# Altium schematic sheet PMIC.SchDoc
size A4; SheetNumber: 5; SheetTotal: 7
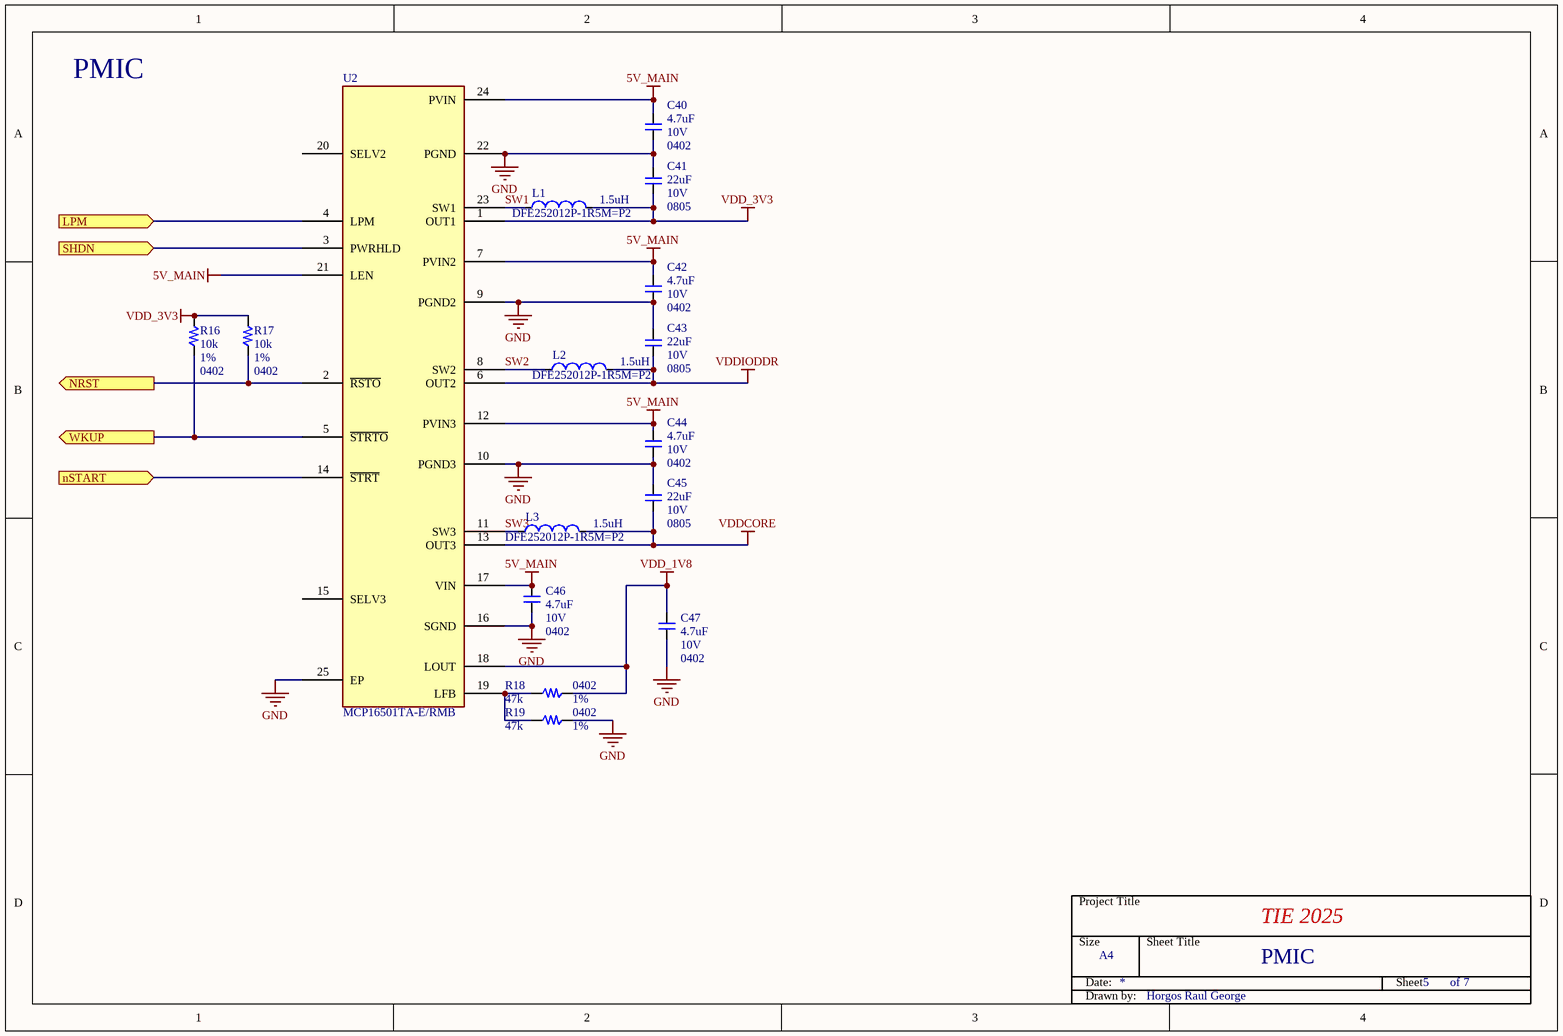
[diagram p0: PMIC.SchDoc]

## Parts
C40  4.7uF  Package: 0402  Rated Voltage: 10V  [CAP0402]
C41  22uF  Rated Voltage: 10V  Package: 0805  [CAP0805]
C42  4.7uF  Package: 0402  Rated Voltage: 10V  [CAP0402]
C43  22uF  Rated Voltage: 10V  Package: 0805  [CAP0805]
C44  4.7uF  Package: 0402  Rated Voltage: 10V  [CAP0402]
C45  22uF  Rated Voltage: 10V  Package: 0805  [CAP0805]
C46  4.7uF  Package: 0402  Rated Voltage: 10V  [CAP0402]
C47  4.7uF  Package: 0402  Rated Voltage: 10V  [CAP0402]
L1  1.5uH  [INDUCTOR1008]
L2  1.5uH  [INDUCTOR1008]
L3  1.5uH  [INDUCTOR1008]
R16  10k  Tolerance: 1%  Package: 0402  [RES0402]
R17  10k  Tolerance: 1%  Package: 0402  [RES0402]
R18  47k  Tolerance: 1%  Package: 0402  [RES0402]
R19  47k  Tolerance: 1%  Package: 0402  [RES0402]
Title_5  Title Block  (value not drawn)  (graphical)
U2  MCP16501TA-E/RMB  [QFN-24]

## Ports
LPM (in, see MPU-System[1B]), NRST (out, see MPU-System[1A], SDCard-MIPI-User[2D]), nSTART (in, see SDCard-MIPI-User[1D]), SHDN (in, see MPU-System[1B]), WKUP (out, see MPU-System[1B])

## Nets
5V_MAIN: C40.2 C42.2 C44.2 C46.2 U2.7(PVIN2) U2.12(PVIN3) U2.17(VIN) U2.21(LEN) U2.24(PVIN)
GND: C40.1 C41.2 C42.1 C43.2 C44.1 C45.2 C46.1 C47.1 R19.2 U2.9(PGND2) U2.10(PGND3) U2.16(SGND) U2.22(PGND) U2.25(EP)
VDD_1V8: C47.2 R18.2 U2.18(LOUT)
VDD_3V3: C41.1 L1.2 R16.2 R17.2 U2.1(OUT1)
VDDCORE: C45.1 L3.2 U2.13(OUT3)
VDDIODDR: C43.1 L2.2 U2.6(OUT2)
LPM: U2.4(LPM) ; port LPM
NRST: R17.1 U2.2(~{RSTO}) ; port NRST
nSTART: U2.14(~{STRT}) ; port nSTART
SHDN: U2.3(PWRHLD) ; port SHDN
SW1: L1.1 U2.23(SW1)
SW2: L2.1 U2.8(SW2)
SW3: L3.1 U2.11(SW3)
WKUP: R16.1 U2.5(~{STRTO}) ; port WKUP
NetR18_1: R18.1 R19.1 U2.19(LFB)

Not connected (* = marked no-connect by the designer): U2 15(SELV3) 20(SELV2)

## Notes on the sheet
- PMIC
- (in symbol Title Block) Project Title; TIE 2025; Size; Sheet Title; A4; Date:; Sheet; of; Drawn by:; Horgos Raul George

## Library data of the parts
C40 C42 C44 C46 C47 = C1005X5R1A475K050BC: CAP CER 4.7uF 10V 10% X5R SMD 0402; Manufacturer: TDK Corporation; .Checked_PCB: AI; Manufacturer Part Number: C1005X5R1A475K050BC; .Checked_SCH: AI; .Creator: AI
C41 C43 C45 = C2012X7S1A226M125AC: CAP CER 22uF 10V 20% X7S SMD 0805; Manufacturer: TDK Corporation; Manufacturer Part Number: C2012X7S1A226M125AC
L1-L3 = DFE252012P-1R5M=P2: INDUCTOR 1.5uH 3.5A 20% SMD 1008; Manufacturer: Murata Electronics North; .Checked_PCB: AI; .Checked_SCH: AI; .Creator: AI; Parameter 1: *; Manufacturer Part Number: DFE252012P-1R5M=P2
R16 R17 = ERJ-2RKF1002X: RES TKF 10k 1% 1/10W SMD 0402; Manufacturer: Panasonic; Manufacturer Part Number: ERJ-2RKF1002X
R18 R19 = ERJ-2RKF4702X: RES TKF 47k 1% 1/10W SMD 0402 AEC-Q200; Manufacturer: Panasonic - ECG; Manufacturer Part Number: ERJ-2RKF4702X
U2 = MCP16501TA-E/RMB: MCHP ANALOG PMIC SWITCHER Buck ADJ MCP16501TA-E/RMB / QFN-24; Manufacturer: Microchip Technology; Manufacturer Part Number: MCP16501TA-E/RMB